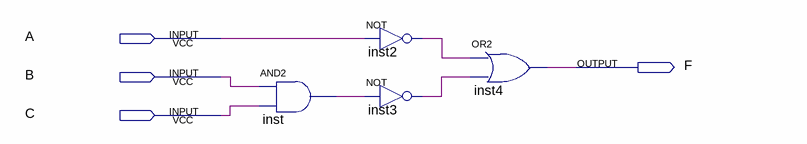
[diagram p0: schematic sheet]
// Quartus schematic lab2.bdf as structural Verilog: 4 symbols, 4 pins
module lab2 (
  input  A,
  input  B,
  input  C,
  output F
);

  wire inst2_out, inst3_out, inst_out;

  and inst (inst_out, B, C);
  not inst2 (inst2_out, A);
  not inst3 (inst3_out, inst_out);
  or inst4 (F, inst2_out, inst3_out);
endmodule
